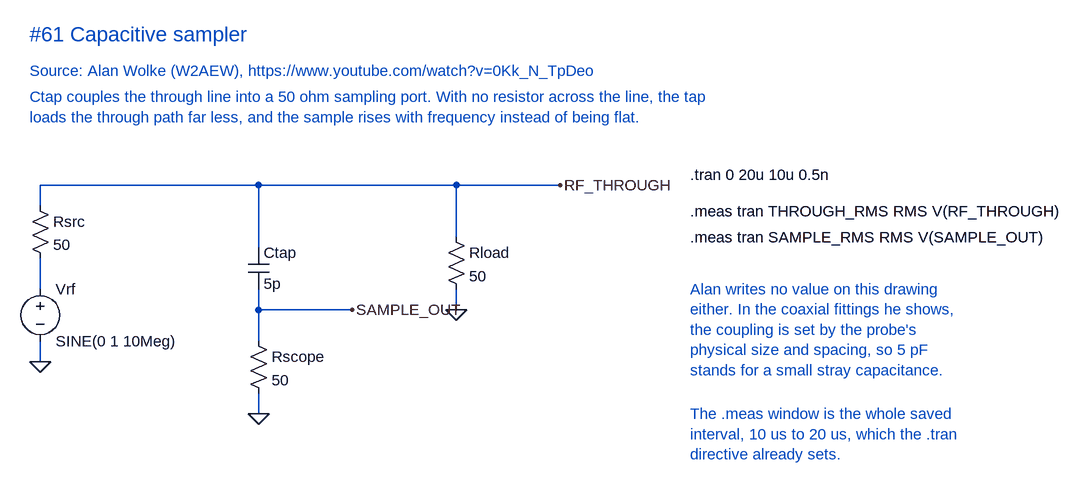
[diagram p0: schematic Capacitive sampler.asc]
Capacitive sampler.asc, the LTspice schematic file:
Version 4
SHEET 1 1280 820
WIRE -240 32 -240 0
WIRE -240 160 -240 112
WIRE -240 272 -240 240
WIRE 96 0 -240 0
WIRE 400 0 96 0
WIRE 560 0 400 0
WIRE 96 96 96 0
WIRE 96 192 96 160
WIRE 96 240 96 192
WIRE 96 352 96 320
WIRE 240 192 96 192
WIRE 400 80 400 0
WIRE 400 192 400 160
FLAG -240 272 0
FLAG 96 352 0
FLAG 400 192 0
FLAG 560 0 RF_THROUGH
FLAG 240 192 SAMPLE_OUT
SYMBOL res -256 16 R0
SYMATTR InstName Rsrc
SYMATTR Value 50
SYMBOL voltage -240 144 R0
WINDOW 123 0 0 Left 0
WINDOW 39 0 0 Left 0
SYMATTR InstName Vrf
SYMATTR Value SINE(0 1 10Meg)
SYMBOL cap 80 96 R0
SYMATTR InstName Ctap
SYMATTR Value 5p
SYMBOL res 80 224 R0
SYMATTR InstName Rscope
SYMATTR Value 50
SYMBOL res 384 64 R0
SYMATTR InstName Rload
SYMATTR Value 50
TEXT -256 -232 Left 3 ;#61 Capacitive sampler
TEXT -256 -176 Left 2 ;Source: Alan Wolke (W2AEW), https://www.youtube.com/watch?v=0Kk_N_TpDeo
TEXT -256 -136 Left 2 ;Ctap couples the through line into a 50 ohm sampling port. With no resistor across the line, the tap\nloads the through path far less, and the sample rises with frequency instead of being flat.
TEXT 760 -16 Left 2 !.tran 0 20u 10u 0.5n
TEXT 760 40 Left 2 !.meas tran THROUGH_RMS RMS V(RF_THROUGH)
TEXT 760 80 Left 2 !.meas tran SAMPLE_RMS RMS V(SAMPLE_OUT)
TEXT 760 160 Left 2 ;Alan writes no value on this drawing\neither. In the coaxial fittings he shows,\nthe coupling is set by the probe's\nphysical size and spacing, so 5 pF\nstands for a small stray capacitance.
TEXT 760 352 Left 2 ;The .meas window is the whole saved\ninterval, 10 us to 20 us, which the .tran\ndirective already sets.

The netlist it stands for:
* Capacitive sampler.asc
Rsrc RF_THROUGH N001 50
Vrf N001 0 SINE(0 1 10Meg)
Ctap RF_THROUGH SAMPLE_OUT 5p
Rscope SAMPLE_OUT 0 50
Rload RF_THROUGH 0 50
* #61 Capacitive sampler
* Source: Alan Wolke (W2AEW), https://www.youtube.com/watch?v=0Kk_N_TpDeo
* Ctap couples the through line into a 50 ohm sampling port. With no resistor across the line, the tap
* loads the through path far less, and the sample rises with frequency instead of being flat.
.tran 0 20u 10u 0.5n
.meas tran THROUGH_RMS RMS V(RF_THROUGH)
.meas tran SAMPLE_RMS RMS V(SAMPLE_OUT)
* Alan writes no value on this drawing
* either. In the coaxial fittings he shows,
* the coupling is set by the probe's
* physical size and spacing, so 5 pF
* stands for a small stray capacitance.
* The .meas window is the whole saved
* interval, 10 us to 20 us, which the .tran
* directive already sets.
.backanno
.end